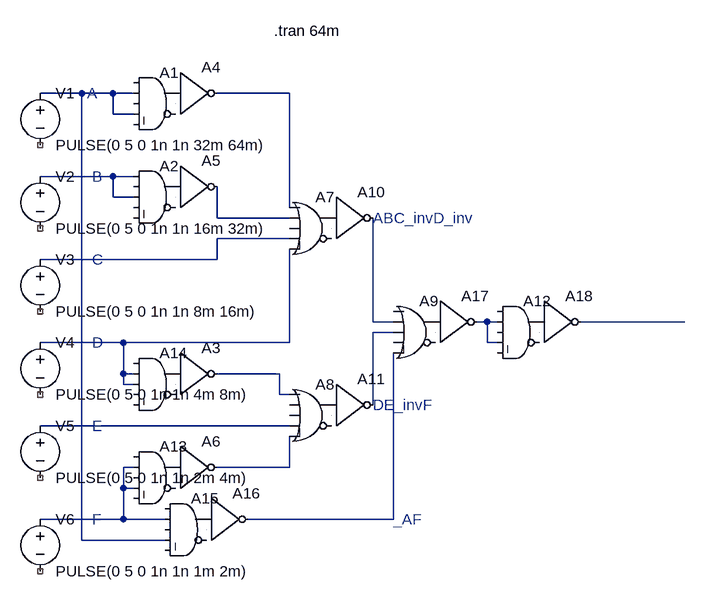
[diagram p0: schematic 12b.asc]
12b.asc, the LTspice schematic file:
Version 4.1
SHEET 1 1700 736
WIRE 128 -16 64 -16
WIRE 176 -16 128 -16
WIRE 208 -16 176 -16
WIRE 448 -16 336 -16
WIRE 176 16 176 -16
WIRE 208 16 176 16
WIRE 176 112 64 112
WIRE 208 112 176 112
WIRE 176 144 176 112
WIRE 208 144 176 144
WIRE 448 160 448 -16
WIRE 336 176 336 128
WIRE 448 176 336 176
WIRE 448 208 336 208
WIRE 336 240 336 208
WIRE 336 240 64 240
WIRE 576 336 576 176
WIRE 608 336 576 336
WIRE 752 336 736 336
WIRE 768 336 752 336
WIRE 1056 336 896 336
WIRE 608 352 576 352
WIRE 192 368 64 368
WIRE 448 368 448 224
WIRE 448 368 192 368
WIRE 752 368 752 336
WIRE 768 368 752 368
WIRE 192 416 192 368
WIRE 208 416 192 416
WIRE 432 416 336 416
WIRE 192 432 192 416
WIRE 208 432 192 432
WIRE 432 448 432 416
WIRE 448 448 432 448
WIRE 576 464 576 352
WIRE 448 496 64 496
WIRE 208 560 192 560
WIRE 448 560 448 512
WIRE 448 560 336 560
WIRE 192 592 192 560
WIRE 208 592 192 592
WIRE 192 640 192 592
WIRE 192 640 64 640
WIRE 256 640 192 640
WIRE 608 640 608 384
WIRE 608 640 384 640
WIRE 128 672 128 -16
WIRE 256 672 128 672
SYMBOL voltage 64 -32 R0
WINDOW 123 0 0 Left 0
WINDOW 39 0 0 Left 0
SYMATTR InstName V1
SYMATTR Value PULSE(0 5 0 1n 1n 32m 64m)
SYMBOL voltage 64 96 R0
WINDOW 123 0 0 Left 0
WINDOW 39 0 0 Left 0
SYMATTR InstName V2
SYMATTR Value PULSE(0 5 0 1n 1n 16m 32m)
SYMBOL voltage 64 224 R0
WINDOW 123 0 0 Left 0
WINDOW 39 0 0 Left 0
SYMATTR InstName V3
SYMATTR Value PULSE(0 5 0 1n 1n 8m 16m)
SYMBOL voltage 64 352 R0
WINDOW 123 0 0 Left 0
WINDOW 39 0 0 Left 0
SYMATTR InstName V4
SYMATTR Value PULSE(0 5 0 1n 1n 4m 8m)
SYMBOL voltage 64 480 R0
WINDOW 123 0 0 Left 0
WINDOW 39 0 0 Left 0
SYMATTR InstName V5
SYMATTR Value PULSE(0 5 0 1n 1n 2m 4m)
SYMBOL voltage 64 624 R0
WINDOW 123 0 0 Left 0
WINDOW 39 0 0 Left 0
SYMATTR InstName V6
SYMATTR Value PULSE(0 5 0 1n 1n 1m 2m)
SYMBOL Digital\\and 240 -64 R0
SYMATTR InstName A1
SYMBOL Digital\\and 240 80 R0
SYMATTR InstName A2
SYMBOL Digital\\inv 272 -80 R0
SYMATTR InstName A4
SYMBOL Digital\\inv 272 64 R0
SYMATTR InstName A5
SYMBOL Digital\\or 480 128 R0
SYMATTR InstName A7
SYMBOL Digital\\or 480 416 R0
SYMATTR InstName A8
SYMBOL Digital\\inv 512 112 R0
SYMATTR InstName A10
SYMBOL Digital\\inv 512 400 R0
SYMATTR InstName A11
SYMBOL Digital\\and 240 512 R0
SYMATTR InstName A13
SYMBOL Digital\\and 240 368 R0
SYMATTR InstName A14
SYMBOL Digital\\inv 272 352 R0
SYMATTR InstName A3
SYMBOL Digital\\inv 272 496 R0
SYMATTR InstName A6
SYMBOL Digital\\and 288 592 R0
SYMATTR InstName A15
SYMBOL Digital\\inv 320 576 R0
SYMATTR InstName A16
SYMBOL Digital\\or 640 288 R0
SYMATTR InstName A9
SYMBOL Digital\\and 800 288 R0
SYMATTR InstName A12
SYMBOL Digital\\inv 672 272 R0
SYMATTR InstName A17
SYMBOL Digital\\inv 832 272 R0
SYMATTR InstName A18
TEXT 424 -112 Left 2 !.tran 64m
TEXT 136 -16 Left 2 ;A
TEXT 144 112 Left 2 ;B
TEXT 144 240 Left 2 ;C
TEXT 144 368 Left 2 ;D
TEXT 144 496 Left 2 ;E
TEXT 144 640 Left 2 ;F
TEXT 608 640 Left 2 ;_AF
TEXT 576 176 Left 2 ;ABC_invD_inv
TEXT 576 464 Left 2 ;DE_invF

The netlist it stands for:
* 12b.asc
V1 N001 NC_01 PULSE(0 5 0 1n 1n 32m 64m)
V2 N003 NC_02 PULSE(0 5 0 1n 1n 16m 32m)
V3 N005 NC_03 PULSE(0 5 0 1n 1n 8m 16m)
V4 N010 NC_04 PULSE(0 5 0 1n 1n 4m 8m)
V5 N012 NC_05 PULSE(0 5 0 1n 1n 2m 4m)
V6 N013 NC_06 PULSE(0 5 0 1n 1n 1m 2m)
A1 0 N001 0 N001 0 0 P001 0 AND
A2 N003 0 N003 0 0 0 P002 0 AND
A4 P001 0 0 0 0 N002 0 0 BUF
A5 P002 0 0 0 0 N004 0 0 BUF
A7 N002 N004 0 N005 N010 0 P003 0 OR
A8 N011 0 0 N012 N014 0 P004 0 OR
A10 P003 0 0 0 0 N006 0 0 BUF
A11 P004 0 0 0 0 N009 0 0 BUF
A13 0 N013 0 N013 0 0 P005 0 AND
A14 0 N010 N010 0 0 0 P006 0 AND
A3 P006 0 0 0 0 N011 0 0 BUF
A6 P005 0 0 0 0 N014 0 0 BUF
A15 0 N013 0 N001 0 0 P007 0 AND
A16 P007 0 0 0 0 N015 0 0 BUF
A9 0 N006 N009 0 N015 0 P008 0 OR
A12 0 N007 0 N007 0 0 P009 0 AND
A17 P008 0 0 0 0 N007 0 0 BUF
A18 P009 0 0 0 0 N008 0 0 BUF
.tran 64m
* A
* B
* C
* D
* E
* F
* _AF
* ABC_invD_inv
* DE_invF
.backanno
.end